# Altium schematic sheet headers.SchDoc
size A4; SheetNumber: 7; SheetTotal: 8
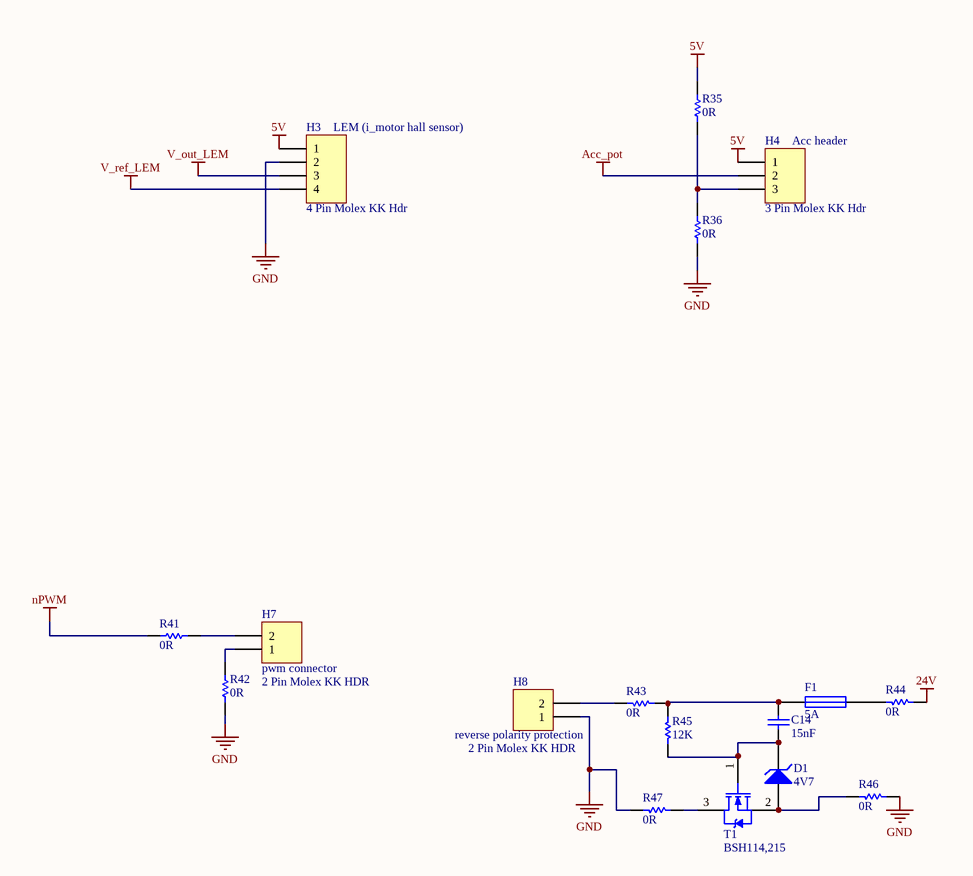
[diagram p0: headers.SchDoc]

## Parts
C14  15nF  [CAPC1608L]
D1  4V7  [SOT23_L]
F1  5A  [RESC3216N]
H3  LEM (i_motor hall sensor)  value 4 Pin Molex KK Hdr  [MOLEX_KK_4_HDR]
H4  Acc header  value 3 Pin Molex KK Hdr  [MOLEX_KK_3_HDR]
H7  pwm connector  value 2 Pin Molex KK HDR  [MOLEX_KK_2_HDR]
H8  reverse polarity protection  value 2 Pin Molex KK HDR  [MOLEX_KK_2_HDR]
R35  0R  [RESC1608L]
R36  0R  [RESC1608L]
R41  0R  [RESC1608L]
R42  0R  [RESC1608L]
R43  0R  [RESC1608L]
R44  0R  [RESC1608L]
R45  12K  [RESC1608L]
R46  0R  [RESC1608L]
R47  0R  [RESC1608L]
T1  BSH114,215  [SOT23_L]

## Nets
5V: H3.1 H4.1 R35.2
24V: R44.1
Acc_pot: H4.2
GND: H3.2 H8.1 R36.1 R42.1 R46.1 R47.2
nPWM: R41.1
V_out_LEM: H3.3
V_ref_LEM: H3.4
NetC14_1: C14.1 D1.3(K) R45.2 T1.1
NetC14_2: C14.2 F1.1 R43.1 R45.1
NetD1_1: D1.1(A) R46.2 T1.2
NetF1_2: F1.2 R44.2
NetH4_3: H4.3 R35.1 R36.2
NetH7_1: H7.1 R42.2
NetH7_2: H7.2 R41.2
NetH8_2: H8.2 R43.2
NetR47_1: R47.1 T1.3

## Library data of the parts
C14 = CC_15nF_0603: CAP CER 15nF X7R +-10% 50V 0603; PackageReference: 0603; Code_IPC: 1608 [0603]; Verify: *; Supplier: ECE Dept; Storage Location: PCB Assembly WS; Value: 15nF
D1 = DZ_4.7V: BZX84C4V7LT1G - DIODE, ZENER, 4.7V, 225MW, SOT23; Manufacturer: ON SEMICONDUCTOR; Breakdown Voltage Max: 5; Breakover Voltage Min: 4.7; Diode Case Style: SOT-23; Power Dissipation Pd: 225; Supplier 1: Farnell; Supplier 2: Digi-Key; Supplier Part Number 1: 1459051; Supplier Part Number 2: BZX84C4V7LT1GOSCT-ND; Manufacturer Part Number: BZX84C4V7LT1G
F1 = FS_Fuse_5.0A: Fuse 5.0A Fast Acting 1206 SMD; Manufacturer: Bel TRP; Manufacturer Part Number: C1F5; Voltage Rating (AC): 125V; Voltage Rating (DC): 63V; DC Cold Resistance: 19mR; Fuse Type: Board Mount (Cartridge Style Excluded); Approvals: CE,cURus; Supplier 1: Digi-Key; Supplier 2: Element14; Current Rating: 5A; Supplier Part Number 2: 2848595; Supplier Part Number 1: 507-1886-1-ND; Value: 5A; Mount: Surface Mount; Case/Package: 1206; Number of Pins: 2; Case Code (Metric): 3216; Case Code (Imperial): 1206; Contact Plating: Nickel,Tin; Min Operating Temperature: -55°C; Max Operating Temperature: 125°C; Packaging: Tape and Reel; Voltage Rating: 125V; Length: 0.126inch; Width: 0.062inch; Stock 1: 725; Pricing 1: 1=0.32, 5=0.312, 10=0.298, 50=0.2662, 100=0.2479, 250=0.22032, 500=0.1836, 1000=0.17442 (USD); ComponentLink1URL: http://www.farnell.com/datasheets/2571625.pdf; ComponentLink1Description: http://www.farnell.com/datasheets/2571625.pdf; ComponentLink2URL: http://belfuse.com/pdfs/C1F.pdf; ComponentLink2Description: http://belfuse.com/pdfs/C1F.pdf; ComponentLink3URL: http://www.mouser.com/ds/2/643/C1F-594910.pdf; ComponentLink3Description: http://www.mouser.com/ds/2/643/C1F-594910.pdf; ComponentLink4URL: https://belfuse.com/resources/StewartConnector/C1F.pdf; ComponentLink4Description: https://belfuse.com/resources/StewartConnector/C1F.pdf
H3 = JA_MOLEX_KK_4POS: CONN HEADER 4POS 2.54mm VERT_Thru Hole; Manufacturer: Molex; Manufacturer PN: 22-23-2041; Supplier Part Number 1: 9731164; Supplier: ECE Dept; Supplier 1: Farnell; Storage Location: ECE Dept Store
H4 = JA_MOLEX_KK_3POS: CONN HEADER 3POS 2.54mm VERT_Thru Hole; Manufacturer: Molex; Manufacturer PN: 22-23-2031; Supplier Part Number 1: 9731156; Supplier: ECE Dept; Supplier 1: Farnell; Storage Location: ECE Dept Store
H7 H8 = JA_MOLEX_KK_2POS: CONN HEADER 2POS 2.54mm VERT_Thru Hole; Supplier 1: Farnell; Supplier Part Number 1: 1462926; Supplier: ECE Dept; Storage Location: ECE Dept Store
R35 R36 R41-R47 = RS_0R0: RES 0.0 OHM 1/10W 5% 0603 SMD; Storage Location: PCB Assembly WS; Supplier: ECE Dept
  R35 R36 R41-R44 R46 R47: Value: 0R
  R45: Value: 12K
T1 = TM_BSH114: MOSFET N-CH 100V 0.85A SOT-23; Continuous Drain Current Id: 500; Current Id Max: 850; Drain Source Voltage Vds: 100; Power Dissipation Pd: 830; Transistor Type: Enhancement; Voltage Vds Typ: 130; Voltage Vgs Max: 3; Voltage Vgs Rds on Measurement: 10; Transistor Case Style: SOT-23; Supplier 1: Farnell; Supplier Part Number 1: 1758071RL; Manufacturer Part Number: BSH114,215